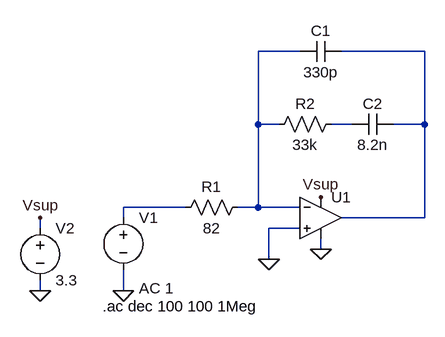
[diagram p0: schematic compensator.asc]
compensator.asc, the LTspice schematic file:
Version 4.1
SHEET 1 880 680
WIRE 128 -112 64 -112
WIRE 320 -112 192 -112
WIRE 64 0 64 -112
WIRE 96 0 64 0
WIRE 208 0 176 0
WIRE 320 0 320 -112
WIRE 320 0 272 0
WIRE -48 128 -144 128
WIRE 64 128 64 0
WIRE 64 128 32 128
WIRE 128 128 64 128
WIRE -144 144 -144 128
WIRE 320 144 320 0
WIRE 320 144 192 144
WIRE -272 160 -272 144
WIRE 128 160 80 160
WIRE 160 192 160 176
WIRE 80 208 80 160
WIRE -272 256 -272 240
WIRE -144 256 -144 224
FLAG 80 208 0
FLAG -144 256 0
FLAG -272 256 0
FLAG 160 192 0
FLAG -272 144 Vsup
FLAG 160 112 Vsup
SYMBOL res 48 112 R90
WINDOW 0 0 56 VBottom 2
WINDOW 3 32 56 VTop 2
SYMATTR InstName R1
SYMATTR Value 82
SYMBOL res 192 -16 R90
WINDOW 0 0 56 VBottom 2
WINDOW 3 32 56 VTop 2
SYMATTR InstName R2
SYMATTR Value 33k
SYMBOL cap 192 -128 R90
WINDOW 0 0 32 VBottom 2
WINDOW 3 32 32 VTop 2
SYMATTR InstName C1
SYMATTR Value 330p
SYMBOL cap 272 -16 R90
WINDOW 0 0 32 VBottom 2
WINDOW 3 32 32 VTop 2
SYMATTR InstName C2
SYMATTR Value 8.2n
SYMBOL voltage -144 128 R0
WINDOW 123 24 124 Left 2
WINDOW 39 0 0 Left 0
SYMATTR InstName V1
SYMATTR Value ""
SYMATTR Value2 AC 1
SYMBOL OpAmps\\UniversalOpAmp 160 144 R0
SYMATTR InstName U1
SYMBOL voltage -272 144 R0
WINDOW 123 0 0 Left 0
WINDOW 39 0 0 Left 0
SYMATTR InstName V2
SYMATTR Value 3.3
TEXT -176 280 Left 2 !.ac dec 100 100 1Meg

The netlist it stands for:
* compensator.asc
R1 N001 N004 82
R2 N003 N001 33k
C1 N002 N001 330p
C2 N002 N003 8.2n
V1 N004 0 AC 1
X§U1 0 N001 Vsup 0 N002 level1 Avol=1Meg GBW=10Meg Vos=0 En=0 Enk=0 In=0 Ink=0 Rin=500Meg  ; pins In+ In- V+ V- OUT
V2 Vsup 0 3.3
.ac dec 100 100 1Meg
.lib UniversalOpAmp1.lib
.backanno
.end